# Altium schematic sheet TYPE-C_INTERFACE_SHEET.SchDoc
size A4; SheetNumber: 5; SheetTotal: 10
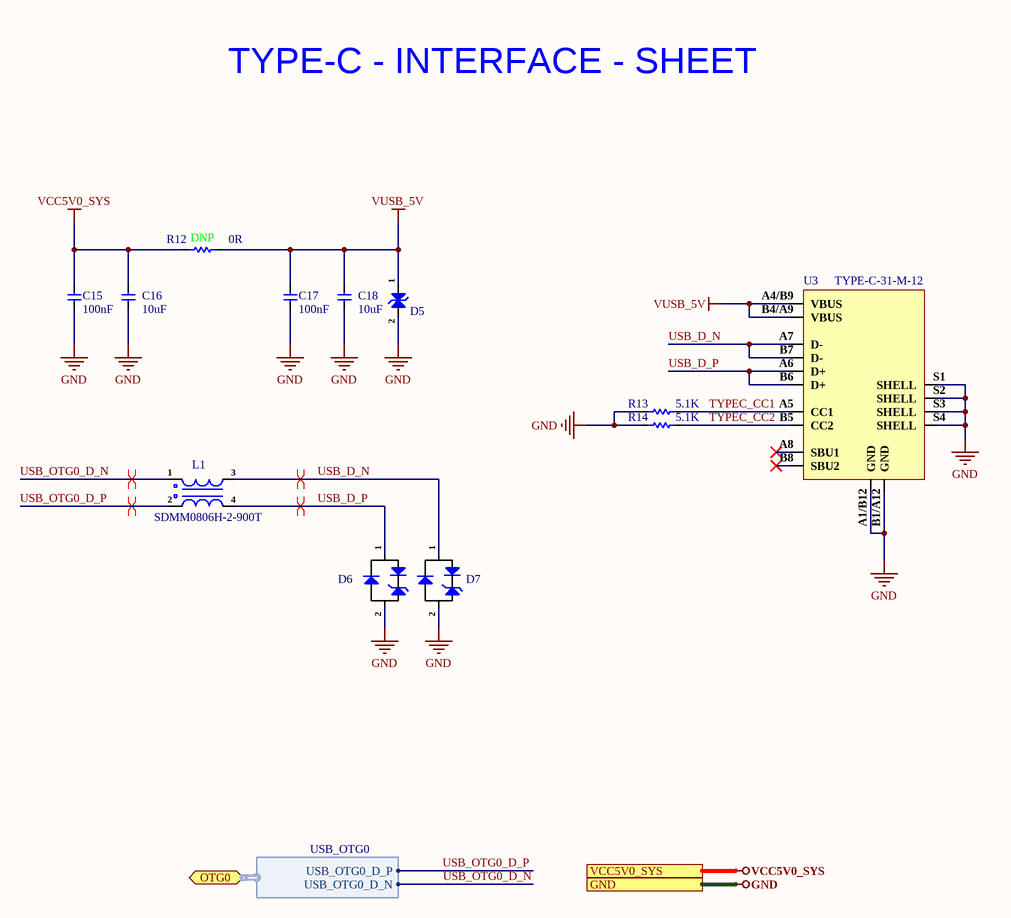
[diagram p0: TYPE-C_INTERFACE_SHEET.SchDoc]

## Parts
C15  100nF  [Cap-0402]
C16  10uF  [Cap-0402]
C17  100nF  [Cap-0402]
C18  10uF  [Cap-0402]
D5  ESD5451N  [DFN1006-2L (Bi-Directional)]  (value not drawn)
D6  ESD5341N-2/TR  [DFN1006-2L_]  (value not drawn)
D7  ESD5341N-2/TR  [DFN1006-2L_]  (value not drawn)
L1  SDMM0806H-2-900T  [0302]
R12  DNP  [Res-0805]
R13  5.1K  [Res-0402]
R14  5.1K  [Res-0402]
U3  TYPE-C-31-M-12  [TYPE-C-31-M-12_]

## Ports
GND (see CAN_SHEET[3D], GPS_INTERFACE_SHEET[3D], HDMI2.0_SHEET[3D], JOYSTICK_BUTTON_SHEET[3D], MIPI_DISPLAY-SHEET[3D], MISCELLANEOUS_SHEET[3D], POWER_SHEET[3C], radxa_CM3J_SHEET-1[4C], radxa_CM3J_SHEET-2[3D]), OTG0 (bidir, harness USB_OTG0, see radxa_CM3J_SHEET-2[1B]), VCC5V0_SYS (see CAN_SHEET[3D], HDMI2.0_SHEET[3D], MIPI_DISPLAY-SHEET[3D], POWER_SHEET[3C], radxa_CM3J_SHEET-1[4C])

## Harnesses
USB_OTG0: USB_OTG0_D_P, USB_OTG0_D_N

## Nets
GND: C15.1 C16.1 C17.1 C18.1 D5.2(K) D6.2(A) D7.2(A) R13.1 R14.1 U3.A1/B12(GND) U3.B1/A12(GND) U3.S1(SHELL) U3.S2(SHELL) U3.S3(SHELL) U3.S4(SHELL) ; port GND
VCC5V0_SYS: C15.2 C16.2 R12.1 ; port VCC5V0_SYS
VUSB_5V: C17.2 C18.2 D5.1(K) R12.2 U3.A4/B9(VBUS) U3.B4/A9(VBUS)
TYPEC_CC1: R13.2 U3.A5(CC1)
TYPEC_CC2: R14.2 U3.B5(CC2)
USB_D_N: D7.1(K) L1.3 U3.A7(D-) U3.B7(D-)
USB_D_P: D6.1(K) L1.4 U3.A6(D+) U3.B6(D+)
USB_OTG0_D_N: L1.1 ; port OTG0.USB_OTG0_D_N
USB_OTG0_D_P: L1.2 ; port OTG0.USB_OTG0_D_P

Not connected (* = marked no-connect by the designer): U3 A8(SBU1)* B8(SBU2)*

## Layout directives
differential pair; differential pair class TYPEC_DP_LINES_90: USB_D_N, USB_D_P, USB_OTG0_D_N, USB_OTG0_D_P

## Notes on the sheet
- TYPE-C - INTERFACE - SHEET
- (near R12) 0R
- File:
- Title:
- Date:
- Page
- Num:
- Total:
- Drawn By: Huzaifa Ali

## Library data of the parts
C15 C17 = CC0402KRX5R7BB104: CAP CER 0.1UF 16V X5R 0402; Manufacturer: Yageo; Tolerance: 10%; Supplier 1: Mouser; Manufacturer Part Number: CC0402KRX5R7BB104; RoHS: Yes; Category: Ceramic Capacitors; Stock 1: 936792; Pricing 1: 1=0.10000, 10=0.02300, 50=0.02300, 100=0.01100, 1000=0.00600, 10000=0.00400 (USD); Mount: Surface Mount; Case/Package: 0402; Number of Pins: 2; Case Code (Metric): 1005; Case Code (Imperial): 0402; Min Operating Temperature: -55°C; Max Operating Temperature: 85°C; Capacitance: 100nF; Dielectric: X5R; Packaging: Tape and Reel; Voltage Rating: 16V; Package Quantity: 1; Voltage Rating (DC): 16V; Termination: SMD/SMT; Resistor Type: Ceramic; Series: CC; Construction: Flat; Length: 1mm; Width: 0.02inch; Height: 0.5mm; Thickness: 0.022inch; Depth: 0.5mm; Radiation Hardening: No; REACH SVHC: Unknown; Lead Free: Lead Free; Halogen Free: Halogen Free; RoHS Compliant: Yes; ComponentLink1URL: https://datasheet.ciiva.com/155/mlccorderingcode-155879.pdf?src-supplier=Digi-Key; ComponentLink1Description: https://datasheet.ciiva.com/155/mlccorderingcode-155879.pdf?src-supplier=Digi-Key; ComponentLink2URL: https://datasheet.ciiva.com/155/mlccorderingcode-155878.pdf?src-supplier=Digi-Key; ComponentLink2Description: https://datasheet.ciiva.com/155/mlccorderingcode-155878.pdf?src-supplier=Digi-Key; ComponentLink3URL: https://datasheet.ciiva.com/155/mlccorderingcode-155880.pdf?src-supplier=Digi-Key; ComponentLink3Description: https://datasheet.ciiva.com/155/mlccorderingcode-155880.pdf?src-supplier=Digi-Key; ComponentLink4URL: https://datasheet.ciiva.com/11464/upy-gphc-x5r-4v-to-50v-12-11464869.pdf?src-supplier=Avnet; ComponentLink4Description: https://datasheet.ciiva.com/11464/upy-gphc-x5r-4v-to-50v-12-11464869.pdf?src-supplier=Avnet; Supplier Part Number 1: 603-CC402KRX5R7BB104; LCSC Part Number: C106204
C16 C18 = CC0402MRX5R6BB106: CAP CER 10UF 10V X5R 0402; Manufacturer: Yageo; Item Type: Capacitor; Tolerance: 20%; Manufacturer Part Number: CC0402MRX5R6BB106; ComponentLink1URL: http://www.yageo.com/documents/recent/UPY-GPHC_X5R_4V-to-50V_25.pdf?src-supplier=Digi-Key; ComponentLink1Description: http://www.yageo.com/documents/recent/UPY-GPHC_X5R_4V-to-50V_25.pdf?src-supplier=Digi-Key; LCSC Part Number: C962143; Supplier 1: Future Electronics; RoHS: Yes; Category: Ceramic Capacitors; Stock 1: 80000; Pricing 1: 10000=0.02650, 20000=0.02590, 30000=0.02550, 40000=0.02530, 50000=0.02450 (USD); Mount: Surface Mount; Case/Package: 0402; Case Code (Imperial): 0402; Case Code (Metric): 1005; Min Operating Temperature: -55°C; Max Operating Temperature: 85°C; Packaging: Tape and Reel; Capacitance: 10uF; Voltage Rating: 10V; RoHS Compliant: Yes; Supplier Part Number 1: 6097631
D5 = ESD5451N: DFN1006-2(0402) ESD Protection Devices ROHS; Manufacturer: TECH PUBLIC; Manufacturer Part Number: ESD5451N; Footprint: DFN1006-2(0402); ComponentLink1Description: LCSC; ComponentLink1URL: https://www.lcsc.com/product-detail/span-style-background-color-ff0-ESD-span-Protection-Devices_TECH-PUBLIC-ESD5451N_C2936977.html; LCSC Part Number: C2936977
D6 D7 = ESD5341N-2/TR: 4A@8/20us 15V 7V 5V Unidirectional DFN1006-2L TVS ROHS; Manufacturer: WILLSEMI; Item Type: Diode; Manufacturer Part Number: ESD5341N-2/TR; Package: DFN1006-2L; ComponentLink1Description: LCSC; ComponentLink1URL: https://www.lcsc.com/product-detail/TVS_WILLSEMI-Will-Semicon-ESD5341N-2-TR_C239773.html; LCSC Part Number: C239773
L1 = SDMM0806H-2-900T: 90Ω@100MHz 4Ω 2 0302 Common Mode Filters ROHS; Manufacturer: Sunlord; Manufacturer Part Number: SDMM0806H-2-900T; Package: 0302; LCSC Part Number: C370285; Item Type: Common Mode Filter; ComponentLink1Description: LCSC; ComponentLink1URL: https://www.lcsc.com/product-detail/Common-Mode-Filters_Sunlord-SDMM0806H-2-900T_C370285.html
R12 = RC0805FR-070RL: RES 0 OHM JUMPER 1/8W 0805; Manufacturer: Yageo; Resistance: 0mR; Tolerance: 1%; Power Rating: 125mW; Item Type: Resistor; Supplier 1: Avnet; Manufacturer Part Number: RC0805FR-070RL; RoHS: Yes; Category: Chip SMD Resistors; Stock 1: 85000; Pricing 1: 5000=0.00281, 10000=0.00277, 20000=0.00269 (USD); Case/Package: 0805; Contact Plating: Tin,Matte; Case Code (Imperial): 0805; Case Code (Metric): 2012; Size Code: 0805; Min Operating Temperature: -55°C; Max Operating Temperature: 155°C; Resistor Type: Thick Film; Packaging: Tape and Reel; Features: Moisture Resistant; Series: RC; Max Power Dissipation: 125mW; Number of Terminations: 2; Construction: Rectangular; Length: 2mm; Depth: 1.25mm; Radiation Hardening: No; Military Standard: Not; Lead Free: Lead Free; RoHS Compliant: Yes; ComponentLink1URL: https://datasheet.ciiva.com/15189/getdatasheetpartid-348154-15189885.pdf?src-supplier=Verical; ComponentLink1Description: https://datasheet.ciiva.com/15189/getdatasheetpartid-348154-15189885.pdf?src-supplier=Verical; ComponentLink2URL: https://datasheet.ciiva.com/17042/rc0805-17042698.pdf?src-supplier=Future+Electronics; ComponentLink2Description: https://datasheet.ciiva.com/17042/rc0805-17042698.pdf?src-supplier=Future+Electronics; Supplier Part Number 1: RC0805FR-070RL; LCSC Part Number: C100045
R13 R14 = RC0402FR-075K1L: RES 5.1K OHM 1% 1/16W 0402; Manufacturer: Yageo; Power Rating: 63mW; Resistance: 5.1kR; Temperature Coefficient: 100ppm/°C; Voltage Rating: 50V; Item Type: Resistor; Supplier 1: Avnet; Manufacturer Part Number: RC0402FR-075K1L; RoHS: Yes; Category: Chip SMD Resistors; Stock 1: 65000; Pricing 1: 10000=0.00085 (USD); Case/Package: 0402; Case Code (Metric): 1005; Case Code (Imperial): 0402; Min Operating Temperature: -55°C; Max Operating Temperature: 155°C; Tolerance: 1%; Technology: THICK FILM; Packaging: Tape and Reel; Package Quantity: 1; Resistor Type: Thick Film; Number of Terminations: 2; Termination: SMD/SMT; Max Power Dissipation: 63mW; Voltage Rating (DC): 50V; Working Voltage: 50V; Features: Moisture Resistant; Series: RC; Resistance Tolerance: 1%; Construction: Rectangular; Length: 1mm; Width: 0.02inch; Height: 0.016inch; Depth: 0.5mm; RoHS Compliant: Yes; Military Standard: Not; Lead Free: Lead Free; ComponentLink1URL: https://datasheet.ciiva.com/7983/1018594-7983519.pdf?src-supplier=Element14; ComponentLink1Description: https://datasheet.ciiva.com/7983/1018594-7983519.pdf?src-supplier=Element14; ComponentLink2URL: https://datasheet.ciiva.com/46394/1018594-46394936.pdf?src-supplier=Element14; ComponentLink2Description: https://datasheet.ciiva.com/46394/1018594-46394936.pdf?src-supplier=Element14; ComponentLink3URL: https://datasheet.ciiva.com/2453/pyu-r-int-thick-7-2453401.pdf?src-supplier=Digi-Key; ComponentLink3Description: https://datasheet.ciiva.com/2453/pyu-r-int-thick-7-2453401.pdf?src-supplier=Digi-Key; ComponentLink4URL: https://datasheet.ciiva.com/2453/pyu-r-int-thick-7-2453402.pdf?src-supplier=Digi-Key; ComponentLink4Description: https://datasheet.ciiva.com/2453/pyu-r-int-thick-7-2453402.pdf?src-supplier=Digi-Key; ComponentLink5URL: https://datasheet.ciiva.com/2453/pyu-r-int-thick-7-2453400.pdf?src-supplier=Digi-Key; ComponentLink5Description: https://datasheet.ciiva.com/2453/pyu-r-int-thick-7-2453400.pdf?src-supplier=Digi-Key; ComponentLink6URL: https://datasheet.ciiva.com/12558/pyu-rc0402-51-rohs-l-6-r-8721-12558460.pdf?src-supplier=Mouser; ComponentLink6Description: https://datasheet.ciiva.com/12558/pyu-rc0402-51-rohs-l-6-r-8721-12558460.pdf?src-supplier=Mouser; ComponentLink7URL: https://datasheet.ciiva.com/16744/pyu-rc0402-51-rohs-l-6-r-16744283.pdf?src-supplier=Future+Electronics; ComponentLink7Description: https://datasheet.ciiva.com/16744/pyu-rc0402-51-rohs-l-6-r-16744283.pdf?src-supplier=Future+Electronics; ComponentLink8URL: https://datasheet.ciiva.com/15189/getdatasheetpartid-323636-15189493.pdf?src-supplier=Verical; ComponentLink8Description: https://datasheet.ciiva.com/15189/getdatasheetpartid-323636-15189493.pdf?src-supplier=Verical; Supplier Part Number 1: RC0402FR-075K1L; LCSC Part Number: C105872
U3 = TYPE-C-31-M-12: 5A 1 16P Female Type-C SMD USB Connectors ROHS; Manufacturer: Korean Hroparts Elec; ComponentLink1Description: LCSC; ComponentLink1URL: https://www.lcsc.com/product-detail/USB-Connectors_Korean-Hroparts-Elec-TYPE-C-31-M-12_C165948.html; Manufacturer Part Number: TYPE-C-31-M-12; Footprint: Custom; LCSC Part Number: C165948; Item Type: USB Connector